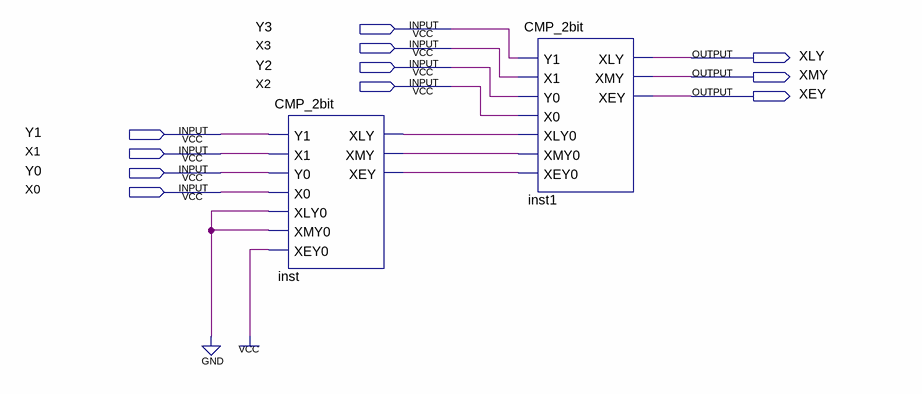
[diagram p0: schematic sheet]
// Quartus schematic CMP_4bit.bdf as structural Verilog: 2 symbols, 11 pins
module CMP_4bit (
  input  Y3,
  input  X3,
  input  Y2,
  input  X2,
  input  Y1,
  input  X1,
  input  Y0,
  input  X0,
  output XLY,
  output XMY,
  output XEY
);

  wire inst_xey, inst_xly, inst_xmy;

  CMP_2bit inst (
    .Y1(Y1), .X1(X1), .Y0(Y0), .X0(X0), .XLY0(1'b0), .XMY0(1'b0), .XEY0(1'b1), .XLY(inst_xly),
    .XMY(inst_xmy), .XEY(inst_xey));
  CMP_2bit inst1 (
    .Y1(Y3), .X1(X3), .Y0(Y2), .X0(X2), .XLY0(inst_xly), .XMY0(inst_xmy), .XEY0(inst_xey), .XLY(XLY),
    .XMY(XMY), .XEY(XEY));
endmodule
